# Altium project Martin_Smith_Project.PrjPcb (part 2 of 2)

## Sheet Connector Section.SchDoc
size A4; DocumentNumber: 6; SheetNumber: 6; SheetTotal: 6
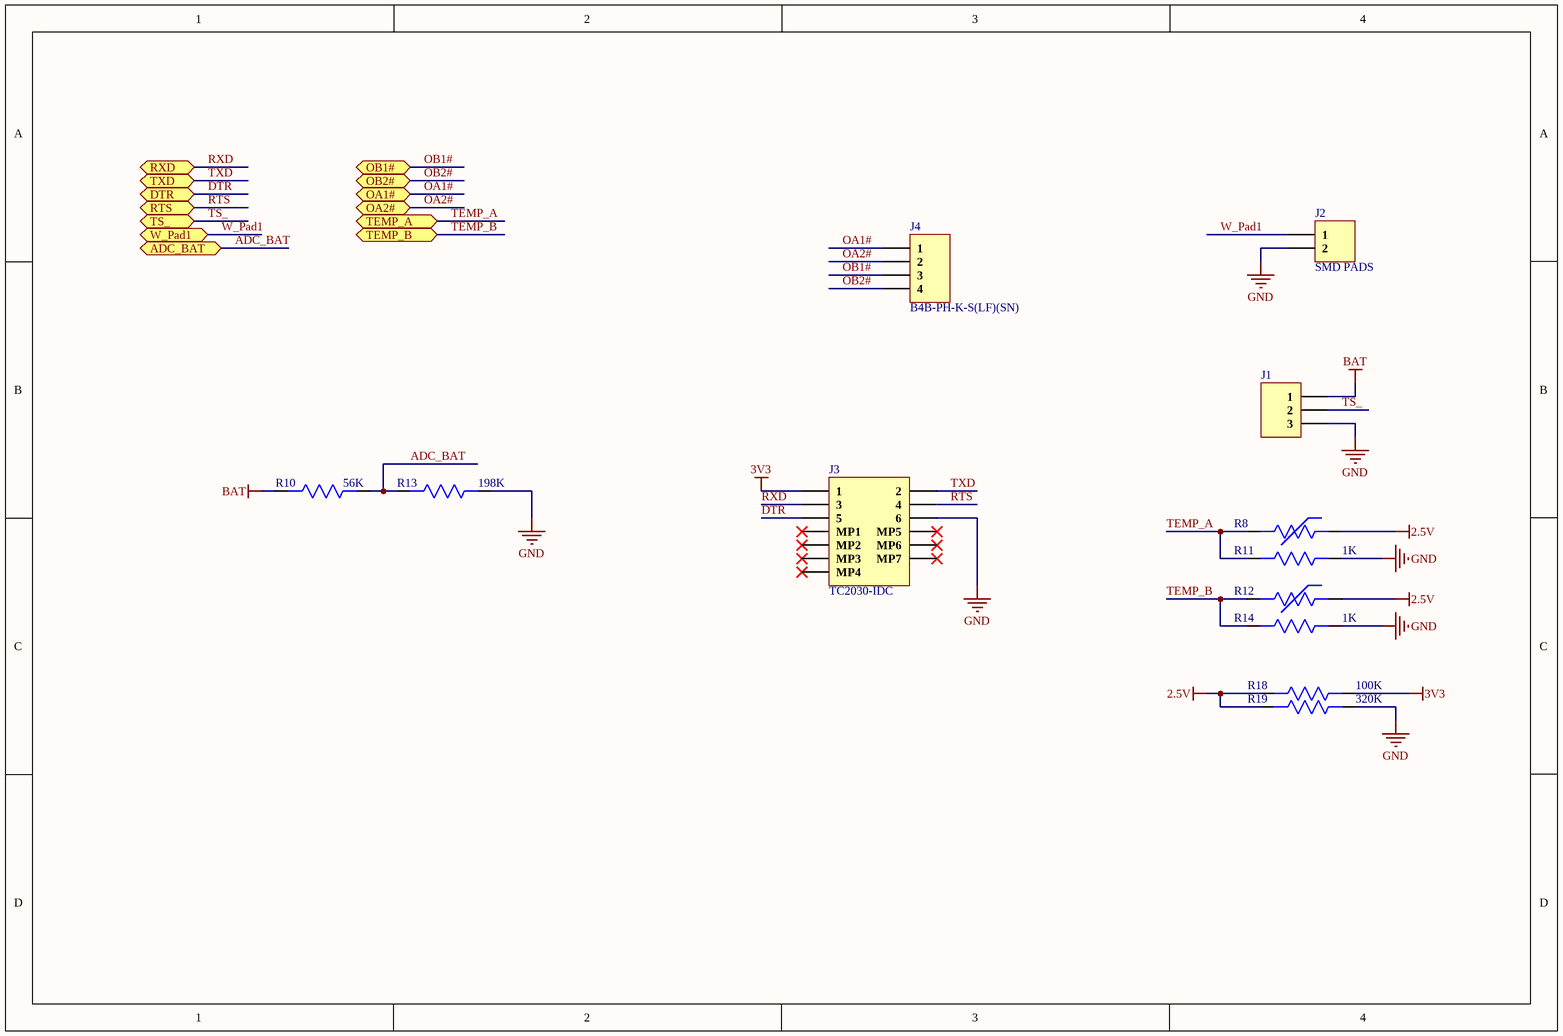
[diagram p3: Connector Section.SchDoc]

### Parts
J1  B3B-PH-K-S(LF)(SN)  [B3B-PH-K-S(LF)(SN)]  (value not drawn)
J2  SMD PADS  [SMD PAD]
J3  TC2030-IDC  [TC2030-IDC]
J4  B4B-PH-K-S(LF)(SN)  [B4B-PH-K-S(LF)(SN)]
R8  B57230V2103F260  [Res0402]  (value not drawn)
R10  56K  [Res-0201]
R11  1K  [Res-0201]
R12  B57230V2103F260  [Res0402]  (value not drawn)
R13  198K  [Res0402]
R14  1K  [Res-0201]
R18  100K  [Res-0201]
R19  320K  [Res0603]

### Ports
ADC_BAT (bidir), DTR (bidir), OA1# (bidir), OA2# (bidir), OB1# (bidir), OB2# (bidir), RTS (bidir), RXD (bidir), TEMP_A (bidir), TEMP_B (bidir), TS_ (bidir), TXD (bidir), W_Pad1 (bidir)

### Nets
2.5V: R8.1 R12.1 R18.2 R19.2
3V3: J3.1 R18.1
BAT: J1.1 R10.2
GND: J1.3 J2.2 J3.6 R11.1 R13.1 R14.1 R19.1
ADC_BAT: R10.1 R13.2 ; port ADC_BAT
DTR: J3.5 ; port DTR
OA1#: J4.1 ; port OA1#
OA2#: J4.2 ; port OA2#
OB1#: J4.3 ; port OB1#
OB2#: J4.4 ; port OB2#
RTS: J3.4 ; port RTS
RXD: J3.3 ; port RXD
TEMP_A: R8.2 R11.2 ; port TEMP_A
TEMP_B: R12.2 R14.2 ; port TEMP_B
TS_: J1.2 ; port TS_
TXD: J3.2 ; port TXD
W_Pad1: J2.1 ; port W_Pad1

Not connected (* = marked no-connect by the designer): J3 MP1* MP2* MP3* MP4* MP5* MP6* MP7*

### Library data of the parts
J1 = B3B-PH-K-S(LF)(SN): CONN HEADER VERT 3POS 2MM; Manufacturer: JST; Number of Positions: 3; Connector Type: Male Pin; Current Rating: 2A; Contact Resistance: 20mR; Voltage Rating (AC): 100V; Insulation Resistance: 1MR; Gender: Male; Supplier 1: Future Electronics; Manufacturer Part Number: B3B-PH-K-S(LF)(SN); RoHS: Yes; Category: Headers and Wire Housings; Pricing 1: 1=0.07800, 500=0.06750, 1500=0.06580, 5000=0.06400, 15000=0.06240 (USD); Mount: Through Hole; Number of Pins: 3; Contact Plating: Tin,Copper; Color: Natural; Contact Material: Brass,Tin; Housing Color: White; Housing Material: Polyamide; Min Operating Temperature: -25°C; Max Operating Temperature: 85°C; Number of Rows: 1; Packaging: Bulk; Max Current Rating: 2A; Number of Poles: 3; Voltage Rating: 100V; Termination: Solder; Fastening Type: Detent; Number of Contacts: 3; Max Voltage Rating (AC): 100V; Max Voltage Rating (DC): 100V; Working Voltage: 100V; Orientation: Straight; Length: 7.9mm; Width: 4.5mm; Height: 9.4mm; Pitch: 2mm; Lead Pitch: 2mm; Contact Mating Length: 0.13inch; Depth: 4.5mm; Lead Free: Lead Free; REACH SVHC: No SVHC; ComponentLink1URL: https://datasheet.ciiva.com/6747/80560-6747401.pdf?src-supplier=Newark; ComponentLink1Description: https://datasheet.ciiva.com/6747/80560-6747401.pdf?src-supplier=Newark; ComponentLink2URL: https://datasheet.ciiva.com/11746/0900766b80826550-11746939.pdf?src-supplier=RSComponents; ComponentLink2Description: https://datasheet.ciiva.com/11746/0900766b80826550-11746939.pdf?src-supplier=RSComponents; ComponentLink3URL: https://datasheet.ciiva.com/26894/getdatasheetpartid-448114-26894774.pdf?src-supplier=Verical; ComponentLink3Description: https://datasheet.ciiva.com/26894/getdatasheetpartid-448114-26894774.pdf?src-supplier=Verical; ComponentLink4URL: https://datasheet.ciiva.com/712/eph-712455.pdf?src-supplier=Digi-Key; ComponentLink4Description: https://datasheet.ciiva.com/712/eph-712455.pdf?src-supplier=Digi-Key; ComponentLink5URL: https://datasheet.ciiva.com/26924/getdatasheetpartid-651387-26924028.pdf?src-supplier=Verical; ComponentLink5Description: https://datasheet.ciiva.com/26924/getdatasheetpartid-651387-26924028.pdf?src-supplier=Verical; ComponentLink6URL: https://datasheet.ciiva.com/16200/eph-16200926.pdf?src-supplier=Future+Electronics; ComponentLink6Description: https://datasheet.ciiva.com/16200/eph-16200926.pdf?src-supplier=Future+Electronics; ComponentLink7URL: https://datasheet.ciiva.com/43491/741202-da-01-en-stiftleiste-gerade-3-pol-rm2-0-43491962.pdf?src-supplier=Conrad; ComponentLink7Description: https://datasheet.ciiva.com/43491/741202-da-01-en-stiftleiste-gerade-3-pol-rm2-0-43491962.pdf?src-supplier=Conrad; Supplier Part Number 1: 6478077
J2 = SMD PAD
J3 = TC2030-IDC: CABLE ADAPTER 6 POS; Manufacturer: Tag-Connect; ComponentLink1URL: http://www.tag-connect.com/Materials/TC2030-MCP%20Datasheet.pdf?src-supplier=Digi-Key; ComponentLink1Description: http://www.tag-connect.com/Materials/TC2030-MCP%20Datasheet.pdf?src-supplier=Digi-Key; Supplier 1: Digi-Key; Manufacturer Part Number: TC2030-IDC; Stock 1: 284; Pricing 1: 1=43.71 (USD); Package Quantity: 1; Supplier Part Number 1: TC2030-IDC-ND
J4 = B4B-PH-K-S(LF)(SN): CONN HEADER VERT 4POS 2MM; Manufacturer: JST; Current Rating: 2A; Voltage Rating: 100V; Contact Resistance: 20mR; Number of Poles: 4; Insulation Resistance: 1MR; Gender: Male; Connector Type: Male Pin; Supplier 1: Newark; Manufacturer Part Number: B4B-PH-K-S(LF)(SN); RoHS: Yes; Category: Connectors; Mount: Through Hole; Number of Pins: 4; Contact Material: Brass,Tin; Contact Plating: Tin,Copper; Color: Natural; Housing Color: White; Housing Material: Polyamide; Material: Polyamide; Min Operating Temperature: -25°C; Max Operating Temperature: 85°C; Number of Rows: 1; Max Current Rating: 2A; Voltage Rating (AC): 100V; Packaging: Bulk; Number of Positions: 4; Termination: Solder; Fastening Type: Detent; Number of Contacts: 4; Max Voltage Rating (AC): 100V; Max Voltage Rating (DC): 100V; Working Voltage: 100V; Orientation: Straight; Length: 9.9mm; Width: 4.5mm; Height: 9.4mm; Pitch: 2mm; Lead Pitch: 2mm; Contact Mating Length: 0.13inch; Depth: 4.5mm; REACH SVHC: No SVHC; Lead Free: Lead Free; ComponentLink1URL: https://datasheet.ciiva.com/11747/0900766b8082f552-11747200.pdf?src-supplier=RSComponents; ComponentLink1Description: https://datasheet.ciiva.com/11747/0900766b8082f552-11747200.pdf?src-supplier=RSComponents; ComponentLink2URL: https://datasheet.ciiva.com/712/eph-712488.pdf?src-supplier=Digi-Key; ComponentLink2Description: https://datasheet.ciiva.com/712/eph-712488.pdf?src-supplier=Digi-Key; ComponentLink3URL: https://datasheet.ciiva.com/16209/eph-16209245.pdf?src-supplier=Future+Electronics; ComponentLink3Description: https://datasheet.ciiva.com/16209/eph-16209245.pdf?src-supplier=Future+Electronics; ComponentLink4URL: https://datasheet.ciiva.com/43491/741223-da-01-en-stiftleiste-gerade-4-pol-rm2-0-43491964.pdf?src-supplier=Conrad; ComponentLink4Description: https://datasheet.ciiva.com/43491/741223-da-01-en-stiftleiste-gerade-4-pol-rm2-0-43491964.pdf?src-supplier=Conrad; Supplier Part Number 1: 37K9958
R8 R12 = B57230V2103F260: THERMISTOR NTC 10KOHM 3380K 0402; Manufacturer: TDK EPCOS; Tolerance: 1%; Resistance: 10kR; Power Rating: 150mW; Supplier 1: Digi-Key; Manufacturer Part Number: B57230V2103F260; RoHS: Yes; Category: Thermistors; Stock 1: 17040; Pricing 1: 1=0.12000, 5=0.11400, 10=0.10200, 25=0.09360, 50=0.07500, 100=0.06430, 500=0.05628, 1000=0.04824, 5000=0.04288 (USD); Mount: Surface Mount; Case/Package: 0402; Number of Pins: 2; Case Code (Metric): 1005; Case Code (Imperial): 0402; Contact Plating: Tin; Min Operating Temperature: -55°C; Max Operating Temperature: 125°C; Package Quantity: 10000; Packaging: Tape and Reel; Max Power Dissipation: 150mW; Termination: SMD/SMT; Series: -; Resistance Tolerance: 1%; Length: 1mm; Width: 0.8mm; Height: 0.9mm; Depth: 0.5mm; REACH SVHC: No SVHC; RoHS Compliant: Yes; ComponentLink1URL: https://datasheet.ciiva.com/29706/ntc-smd-standard-series-0402-29706167.pdf?src-supplier=Digi-Key; ComponentLink1Description: https://datasheet.ciiva.com/29706/ntc-smd-standard-series-0402-29706167.pdf?src-supplier=Digi-Key; ComponentLink2URL: https://datasheet.ciiva.com/29706/ntc-smd-standard-series-0402-29706168.pdf?src-supplier=Digi-Key; ComponentLink2Description: https://datasheet.ciiva.com/29706/ntc-smd-standard-series-0402-29706168.pdf?src-supplier=Digi-Key; ComponentLink3URL: https://datasheet.ciiva.com/46409/1835848-46409416.pdf?src-supplier=Element14; ComponentLink3Description: https://datasheet.ciiva.com/46409/1835848-46409416.pdf?src-supplier=Element14; ComponentLink4URL: https://datasheet.ciiva.com/29706/ntc-smd-standard-series-0402-29706169.pdf?src-supplier=Digi-Key; ComponentLink4Description: https://datasheet.ciiva.com/29706/ntc-smd-standard-series-0402-29706169.pdf?src-supplier=Digi-Key; ComponentLink5URL: https://datasheet.ciiva.com/46409/1835848-46409417.pdf?src-supplier=Element14; ComponentLink5Description: https://datasheet.ciiva.com/46409/1835848-46409417.pdf?src-supplier=Element14; Supplier Part Number 1: 495-5814-1-ND
R10 = AC0201FR-0756KL: RES SMD 56K OHM 1% 1/20W 0201; Manufacturer: Yageo; Resistance: 56kR; Temperature Coefficient: 200ppm/°C; Max Power Dissipation: 50mW; ComponentLink1URL: http://www.yageo.com/NewPortal/yageodocoutput?fileName=/pdf/R-Chip/PYu-AC_51_RoHS_L_5.pdf&src-supplier=Digi-Key; ComponentLink1Description: http://www.yageo.com/NewPortal/yageodocoutput?fileName=/pdf/R-Chip/PYu-AC_51_RoHS_L_5.pdf&src-supplier=Digi-Key; ComponentLink2URL: http://www.yageo.com/NewPortal/yageodocoutput?fileName=/pdf/R-Chip/PYu-AC_51_RoHS_L_6.pdf&src-supplier=Digi-Key; ComponentLink2Description: http://www.yageo.com/NewPortal/yageodocoutput?fileName=/pdf/R-Chip/PYu-AC_51_RoHS_L_6.pdf&src-supplier=Digi-Key; Supplier 1: Digi-Key; Manufacturer Part Number: AC0201FR-0756KL; Stock 1: 23567; Pricing 1: 1=0.10000, 10=0.05700, 100=0.02320, 1000=0.01044, 2500=0.00906, 5000=0.00749 (USD); Case/Package: 0201; Min Operating Temperature: -55°C; Max Operating Temperature: 155°C; Tolerance: 1%; Packaging: Tape and Reel; Features: Moisture Resistant,Automotive AEC-Q200; Resistor Type: Thick Film; Number of Terminations: 2; Length: 0.024inch; Width: 0.012inch; Height: 0.01inch; RoHS Compliant: Yes; Supplier Part Number 1: YAG5226CT-ND; RoHS: Yes; Category: Chip SMD Resistors
R11 R14 = RC0201FR-071KP: RES 1K OHM 1% 1/20W 0201; Manufacturer: Yageo; Supplier 1: Digi-Key; Manufacturer Part Number: RC0201FR-071KP; RoHS: Yes; Stock 1: 4800; Pricing 1: 1=0.11000, 10=0.10200, 100=0.03940, 1000=0.01734, 2500=0.01497, 5000=0.01340 (USD); RoHS Compliant: Yes; Supplier Part Number 1: 13-RC0201FR-071KPCT-ND
R13 = RN73H1ETTP1983D25: RES 198K OHM 0.5% 1/16W 0402; Manufacturer: KOA Speer; Resistance: 198kR; Power Rating: 63mW; Voltage Rating: 50V; Temperature Coefficient: 25ppm/°C; ComponentLink1URL: http://www.yageo.com/documents/recent/PYu-RC_Group_51_RoHS_L_9.pdf?src-supplier=Digi-Key; ComponentLink1Description: http://www.yageo.com/documents/recent/PYu-RC_Group_51_RoHS_L_9.pdf?src-supplier=Digi-Key; ComponentLink2URL: http://www.yageo.com.tw/exep/pages/download/literatures/PYu-R_INT-thick_7.pdf?src-supplier=Digi-Key; ComponentLink2Description: http://www.yageo.com.tw/exep/pages/download/literatures/PYu-R_INT-thick_7.pdf?src-supplier=Digi-Key; Supplier 1: Digi-Key; Manufacturer Part Number: RN73H1ETTP1983D25; Stock 1: 0; Pricing 1: 1000=0.0784 (USD); Case/Package: 0402; Case Code (Imperial): 0402; Case Code (Metric): 1005; Min Operating Temperature: -55°C; Max Operating Temperature: 155°C; Tolerance: 0.5%; Packaging: Tape and Reel; Package Quantity: 10000; RoHS Compliant: Yes; ComponentLink3URL: http://www.koaspeer.com/products/resistors/surface-mount-resistors/rn73h/?src-supplier=Mouser; ComponentLink3Description: http://www.koaspeer.com/products/resistors/surface-mount-resistors/rn73h/?src-supplier=Mouser; Supplier Part Number 1: 2019-RN73H1ETTP1983D25CT-ND
R18 = RC0201FR-07100KL: RES SMD 100K OHM 1% 1/20W 0201; Manufacturer: Yageo; Resistance: 100kR; Power Rating: 50mW; Voltage Rating: 25V; Temperature Coefficient: 200ppm/°C; ComponentLink1URL: http://www.yageo.com/documents/recent/PYu-RC_Group_51_RoHS_L_9.pdf?src-supplier=Digi-Key; ComponentLink1Description: http://www.yageo.com/documents/recent/PYu-RC_Group_51_RoHS_L_9.pdf?src-supplier=Digi-Key; ComponentLink2URL: http://www.yageo.com.tw/exep/pages/download/literatures/PYu-R_INT-thick_7.pdf?src-supplier=Digi-Key; ComponentLink2Description: http://www.yageo.com.tw/exep/pages/download/literatures/PYu-R_INT-thick_7.pdf?src-supplier=Digi-Key; Supplier 1: Digi-Key; Manufacturer Part Number: RC0201FR-07100KL; Stock 1: 2817321; Pricing 1: 1=0.1, 10=0.036, 100=0.0148, 1000=0.0067, 2500=0.0058, 5000=0.0048 (USD); Case/Package: 0201; Number of Pins: 2; Case Code (Imperial): 0201; Case Code (Metric): 0603; Contact Plating: Tin,Matte; Size Code: 0201; Min Operating Temperature: -55°C; Max Operating Temperature: 125°C; Tolerance: 1%; Packaging: Tape and Reel; Package Quantity: 10000; Termination: SMD/SMT; Resistor Type: Thick Film; Number of Terminations: 2; Max Power Dissipation: 50mW; Voltage Rating (DC): 25V; Features: Moisture Resistant; Series: RC; Resistance Tolerance: 1%; Construction: Rectangular; Length: 0.024inch; Width: 0.012inch; Height: 0.01inch; Depth: 0.3mm; REACH SVHC: No SVHC; Military Standard: Not; Lead Free: Lead Free; RoHS Compliant: Yes; ComponentLink3URL: http://www.farnell.com/datasheets/2167052.pdf?src-supplier=Element14; ComponentLink3Description: http://www.farnell.com/datasheets/2167052.pdf?src-supplier=Element14; ComponentLink4URL: http://www.yageo.com/documents/recent/PYu-RC_Group_51_RoHS_L_10.pdf?src-supplier=Digi-Key; ComponentLink4Description: http://www.yageo.com/documents/recent/PYu-RC_Group_51_RoHS_L_10.pdf?src-supplier=Digi-Key; ComponentLink5URL: https://www.verical.com/server-webapp/html/getDatasheet?partID=420441&src-supplier=Verical; ComponentLink5Description: https://www.verical.com/server-webapp/html/getDatasheet?partID=420441&src-supplier=Verical; ComponentLink6URL: http://www.farnell.com/datasheets/1421516.pdf?src-supplier=Element14; ComponentLink6Description: http://www.farnell.com/datasheets/1421516.pdf?src-supplier=Element14; ComponentLink7URL: http://www.yageo.com/documents/recent/PYu-RC0201_51_RoHS_L_8.pdf?src-supplier=Avnet+Europe; ComponentLink7Description: http://www.yageo.com/documents/recent/PYu-RC0201_51_RoHS_L_8.pdf?src-supplier=Avnet+Europe; Supplier Part Number 1: 311-100KMCT-ND
R19 = RN73H1JTTD3203C25: RES 320K OHM 0.25% 1/10W 0603

## Sheet Driver Section.SchDoc
size A4; DocumentNumber: 5; SheetNumber: 5; SheetTotal: 6
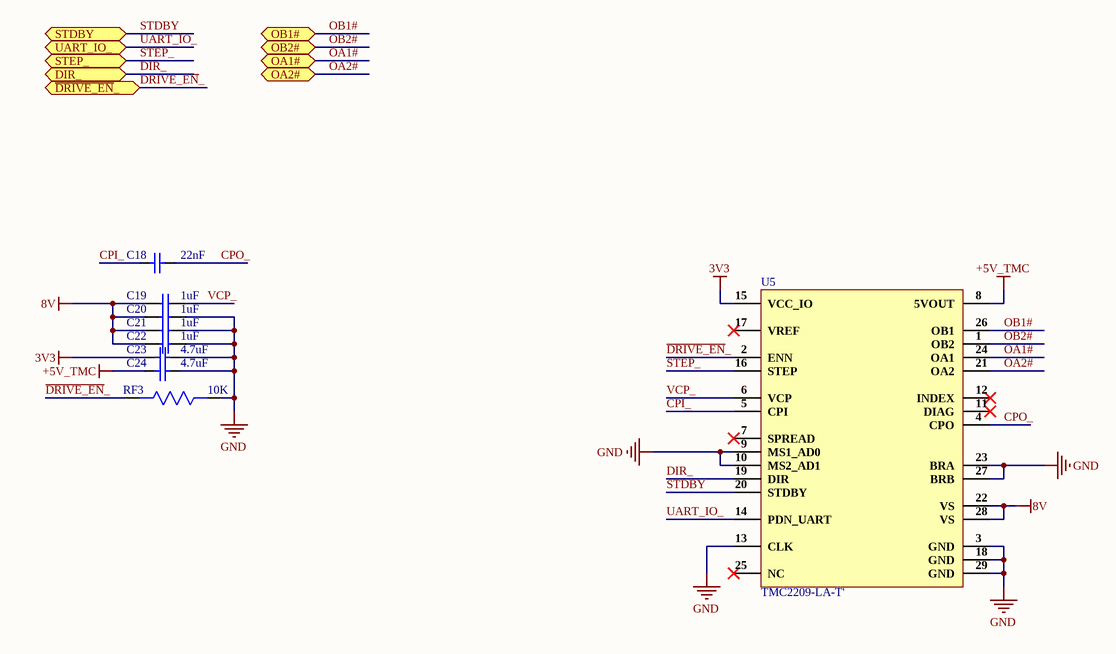
[diagram p4: Driver Section.SchDoc]

### Parts
C18  22nF  [CAP 0201]
C19  1uF  [CAP 0201]
C20  1uF  [CAP 0201]
C21  1uF  [CAP 0201]
C22  1uF  [CAP 0201]
C23  4.7uF  [Cap0402]
C24  4.7uF  [Cap0402]
RF3  10K  [Res-0201]
U5  TMC2209-LA-T'  [QFN-28]

### Ports
DIR_ (bidir), OA1# (bidir), OA2# (bidir), OB1# (bidir), OB2# (bidir), STDBY (bidir), STEP_ (bidir), UART_IO_ (bidir), ~{DRI}~{VE_EN}_ (bidir)

### Nets
3V3: C23.2 U5.15(VCC_IO)
8V: C19.1 C20.1 C21.1 C22.1 U5.22(VS) U5.28(VS)
+5V_TMC: C24.2 U5.8(5VOUT)
GND: C20.2 C21.2 C22.2 C23.1 C24.1 RF3.1 U5.3(GND) U5.9(MS1_AD0) U5.10(MS2_AD1) U5.13(CLK) U5.18(GND) U5.23(BRA) U5.27(BRB) U5.29(GND)
~{DRI}~{VE_EN}_: RF3.2 U5.2(ENN) ; port ~{DRI}~{VE_EN}_
CPI_: C18.2 U5.5(CPI)
CPO_: C18.1 U5.4(CPO)
DIR_: U5.19(DIR) ; port DIR_
OA1#: U5.24(OA1) ; port OA1#
OA2#: U5.21(OA2) ; port OA2#
OB1#: U5.26(OB1) ; port OB1#
OB2#: U5.1(OB2) ; port OB2#
STDBY: U5.20(STDBY) ; port STDBY
STEP_: U5.16(STEP) ; port STEP_
UART_IO_: U5.14(PDN_UART) ; port UART_IO_
VCP_: C19.2 U5.6(VCP)

Not connected (* = marked no-connect by the designer): U5 7(SPREAD)* 11(DIAG)* 12(INDEX)* 17(VREF)* 25(NC)*

### Library data of the parts
C18 = TMK063BJ223KP-F: CAP CER 0.022UF 25V X5R 0201; Manufacturer: Taiyo Yuden; Tolerance: 10%; Supplier 1: Digi-Key; Manufacturer Part Number: TMK063BJ223KP-F; RoHS: No; Category: Ceramic Capacitors; Stock 1: 108943; Pricing 1: 1=0.10000, 10=0.02100, 50=0.01120, 100=0.00920, 500=0.00654, 1000=0.00514, 2500=0.00468, 5000=0.00430 (USD); Mount: Surface Mount; Case/Package: 0201; Case Code (Imperial): 0201; Case Code (Metric): 0603; Min Operating Temperature: -55°C; Max Operating Temperature: 85°C; Packaging: Tape and Reel; Capacitance: 22nF; Voltage Rating: 25V; ComponentLink1URL: https://ds.yuden.co.jp/TYCOMPAS/ut/detail?pn=TMK063BJ223KP-F &amp;u=M&src-supplier=Digi-Key; ComponentLink1Description: https://ds.yuden.co.jp/TYCOMPAS/ut/detail?pn=TMK063BJ223KP-F &amp;u=M&src-supplier=Digi-Key; ComponentLink2URL: http://ds.yuden.co.jp/TYCOMPAS/ut/detail.do?productNo=TMK063BJ223KP-F&amp;fileName=TMK063BJ223KP-F_SS&amp;mode=specSheetDownload&src-supplier=Digi-Key; ComponentLink2Description: http://ds.yuden.co.jp/TYCOMPAS/ut/detail.do?productNo=TMK063BJ223KP-F&amp;fileName=TMK063BJ223KP-F_SS&amp;mode=specSheetDownload&src-supplier=Digi-Key; Supplier Part Number 1: 587-6154-1-ND
C19-C22 = CL03A105MO3NRNH: CAP CER 1UF 16V X5R 0201; Manufacturer: Samsung; Tolerance: 20%; Supplier 1: Digi-Key; Manufacturer Part Number: CL03A105MO3NRNH; RoHS: Yes; Category: Ceramic Capacitors; Stock 1: 66067; Pricing 1: 1=0.27000, 10=0.18500, 50=0.11080, 100=0.09360, 500=0.06406, 1000=0.05667, 2500=0.05421, 5000=0.04928 (USD); Mount: Surface Mount; Case/Package: 0201; Case Code (Metric): 0603; Case Code (Imperial): 0201; Min Operating Temperature: -55°C; Max Operating Temperature: 85°C; Packaging: Tape and Reel; Capacitance: 1uF; Voltage Rating: 16V; Length: 0.024inch; Width: 0.012inch; Thickness: 0.013inch; RoHS Compliant: Yes; ComponentLink1URL: http://www.samsungsem.com/kr/support/product-search/mlcc/CL03A105MO3NRNH.jsp?src-supplier=Digi-Key; ComponentLink1Description: http://www.samsungsem.com/kr/support/product-search/mlcc/CL03A105MO3NRNH.jsp?src-supplier=Digi-Key; Supplier Part Number 1: 1276-6798-1-ND
C23 C24 = GRM155R61A475MEAAD: CAP CER 4.7UF 10V X5R 0402; Manufacturer: Murata; Tolerance: 20%; Supplier 1: Arrow Electronics; Manufacturer Part Number: GRM155R61A475MEAAD; Category: Ceramic Capacitors; Stock 1: 5; Pricing 1: 1=0.15280, 100000=0.02590, 1000000=0.02570, 10000000=0.02490 (USD); Mount: Surface Mount; Case/Package: 0402; Case Code (Imperial): 0402; Case Code (Metric): 1005; Min Operating Temperature: -55°C; Max Operating Temperature: 85°C; Packaging: Tape and Reel; Capacitance: 4.7uF; Voltage Rating: 10V; ComponentLink1URL: http://www.farnell.com/datasheets/2189109.pdf?src-supplier=Farnell; ComponentLink1Description: http://www.farnell.com/datasheets/2189109.pdf?src-supplier=Farnell; ComponentLink2URL: https://search.murata.co.jp/Ceramy/image/img/A01X/G101/ENG/GRM155R61A475MEAA-01.pdf?src-supplier=Digi-Key; ComponentLink2Description: https://search.murata.co.jp/Ceramy/image/img/A01X/G101/ENG/GRM155R61A475MEAA-01.pdf?src-supplier=Digi-Key; ComponentLink3URL: http://www.farnell.com/datasheets/2189109.pdf?src-supplier=Newark; ComponentLink3Description: http://www.farnell.com/datasheets/2189109.pdf?src-supplier=Newark; ComponentLink4URL: http://www.farnell.com/datasheets/2189109.pdf?src-supplier=Element14; ComponentLink4Description: http://www.farnell.com/datasheets/2189109.pdf?src-supplier=Element14; ComponentLink5URL: http://datasheet.octopart.com/GRM155R61A475MEAAD-Murata-datasheet-138740730.pdf?src-supplier=Ciiva+Crawler; ComponentLink5Description: http://datasheet.octopart.com/GRM155R61A475MEAAD-Murata-datasheet-138740730.pdf?src-supplier=Ciiva+Crawler; ComponentLink6URL: http://datasheet.octopart.com/GRM155R61A475MEAAD-Murata-datasheet-140690084.pdf?src-supplier=Ciiva+Crawler; ComponentLink6Description: http://datasheet.octopart.com/GRM155R61A475MEAAD-Murata-datasheet-140690084.pdf?src-supplier=Ciiva+Crawler; ComponentLink7URL: http://datasheet.octopart.com/GRM155R61A475MEAAD-Murata-datasheet-141266224.pdf?src-supplier=Ciiva+Crawler; ComponentLink7Description: http://datasheet.octopart.com/GRM155R61A475MEAAD-Murata-datasheet-141266224.pdf?src-supplier=Ciiva+Crawler; ComponentLink8URL: http://datasheet.octopart.com/GRM155R61A475MEAAD-Murata-datasheet-68589269.pdf?src-supplier=Newark; ComponentLink8Description: http://datasheet.octopart.com/GRM155R61A475MEAAD-Murata-datasheet-68589269.pdf?src-supplier=Newark; ComponentLink9URL: http://datasheet.octopart.com/GRM155R61A475MEAAD-Murata-datasheet-8819587.pdf; ComponentLink9Description: http://datasheet.octopart.com/GRM155R61A475MEAAD-Murata-datasheet-8819587.pdf; ComponentLink10URL: http://datasheet.octopart.com/GRM155R61A475MEAAD-Murata-datasheet-10025737.pdf; ComponentLink10Description: http://datasheet.octopart.com/GRM155R61A475MEAAD-Murata-datasheet-10025737.pdf; ComponentLink11URL: http://datasheet.octopart.com/GRM155R61A475MEAAD-Murata-datasheet-11978611.pdf; ComponentLink11Description: http://datasheet.octopart.com/GRM155R61A475MEAAD-Murata-datasheet-11978611.pdf; ComponentLink12URL: http://datasheet.octopart.com/GRM155R61A475MEAAD-Murata-datasheet-12510076.pdf; ComponentLink12Description: http://datasheet.octopart.com/GRM155R61A475MEAAD-Murata-datasheet-12510076.pdf; ComponentLink13URL: http://datasheet.octopart.com/GRM155R61A475MEAAD-Murata-datasheet-12515295.pdf; ComponentLink13Description: http://datasheet.octopart.com/GRM155R61A475MEAAD-Murata-datasheet-12515295.pdf; Supplier Part Number 1: GRM155R61A475MEAAD
RF3 = RC0201JR-0710KL: RES SMD 10K OHM 5% 1/20W 0201; Manufacturer: Yageo; Voltage Rating (DC): 25V; Power Rating: 50mW; Resistance: 10kR; Temperature Coefficient: 200ppm/°C; Case Code (Imperial): 0201; Case Code (Metric): 0603; Case/Package: 0201; Category: Chip SMD Resistors; Contact Plating: Tin,Matte; Depth: 0.3mm; Lead Free: Lead Free; Length: 0.6mm; Manufacturer Part Number: RC0201JR-0710KL; Max Operating Temperature: 125°C; Military Standard: Not; Min Operating Temperature: -55°C; Packaging: Tape and Reel; Radiation Hardening: No; REACH SVHC: Unknown; Resistor Type: Thick Film; Termination: SMD/SMT; Tolerance: 5%; Voltage Rating: 25V; ComponentLink1Description: New link; ComponentLink1URL: *; Supplier 1: Digi-Key; RoHS: Yes; Stock 1: 1488597; Pricing 1: 1=0.10000, 10=0.02600, 100=0.01050, 1000=0.00472, 2500=0.00410, 5000=0.00338 (USD); ComponentLink2URL: https://datasheet.ciiva.com/8891/pyu-rc0201-51-rohs-l-8-8891388.pdf?src-supplier=Avnet; ComponentLink2Description: https://datasheet.ciiva.com/8891/pyu-rc0201-51-rohs-l-8-8891388.pdf?src-supplier=Avnet; ComponentLink3URL: https://datasheet.ciiva.com/7672/1563626-7672253.pdf?src-supplier=Element14; ComponentLink3Description: https://datasheet.ciiva.com/7672/1563626-7672253.pdf?src-supplier=Element14; ComponentLink4URL: https://datasheet.ciiva.com/28405/pyu-rc0201-51-rohs-l-8-28405613.pdf?src-supplier=Avnet+Europe; ComponentLink4Description: https://datasheet.ciiva.com/28405/pyu-rc0201-51-rohs-l-8-28405613.pdf?src-supplier=Avnet+Europe; ComponentLink5URL: https://datasheet.ciiva.com/7672/1563626-7672254.pdf?src-supplier=Element14; ComponentLink5Description: https://datasheet.ciiva.com/7672/1563626-7672254.pdf?src-supplier=Element14; ComponentLink6URL: https://datasheet.ciiva.com/7660/1421516-7660810.pdf?src-supplier=Element14; ComponentLink6Description: https://datasheet.ciiva.com/7660/1421516-7660810.pdf?src-supplier=Element14; ComponentLink7URL: https://datasheet.ciiva.com/16856/pyu-rc0201-51-rohs-l-8-16856011.pdf?src-supplier=Avnet+Europe; ComponentLink7Description: https://datasheet.ciiva.com/16856/pyu-rc0201-51-rohs-l-8-16856011.pdf?src-supplier=Avnet+Europe; ComponentLink8URL: https://datasheet.ciiva.com/46391/1421516-46391291.pdf?src-supplier=Element14; ComponentLink8Description: https://datasheet.ciiva.com/46391/1421516-46391291.pdf?src-supplier=Element14; Supplier Part Number 1: 311-10KNCT-ND
U5 = TMC2209-LA-T: Motor Driver, Stepper, QFN-28; Manufacturer: Trinamic; Supplier 1: Digi-Key; Manufacturer Part Number: TMC2209-LA-T; RoHS: No; Stock 1: 1949; Pricing 1: 1=2.74000, 50=2.46000, 100=2.17000, 500=1.88000, 1000=1.59001 (USD); Supplier Part Number 1: 1460-1398-1-ND

## Sheet Control_Sheet.SchDoc
size A
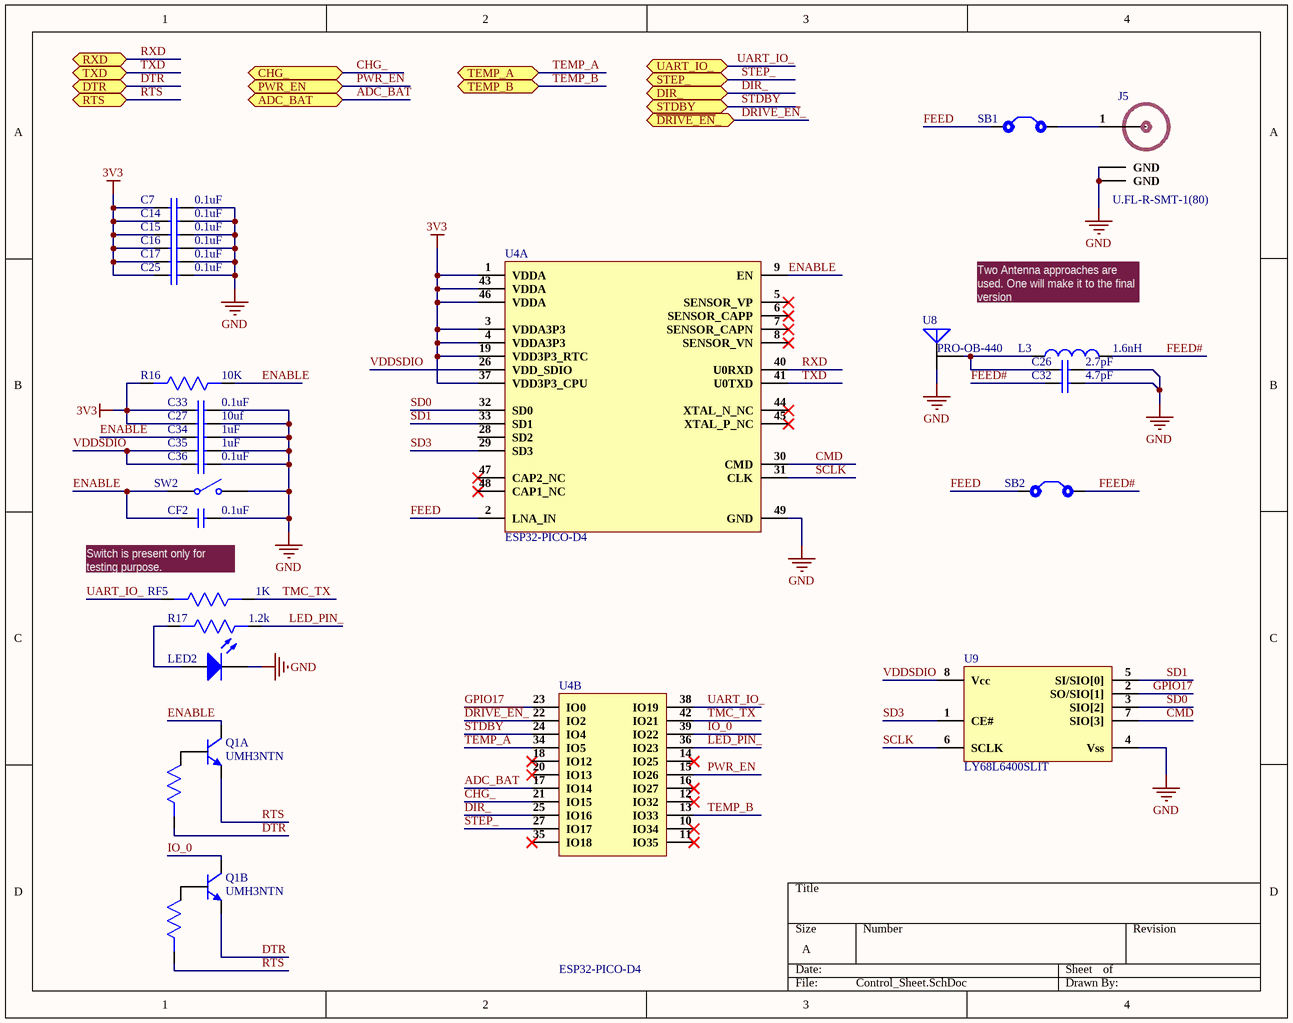
[diagram p5: Control_Sheet.SchDoc]

### Parts
C7  0.1uF  [CAP 0201]
C14  0.1uF  [CAP 0201]
C15  0.1uF  [CAP 0201]
C16  0.1uF  [CAP 0201]
C17  0.1uF  [CAP 0201]
C25  0.1uF  [CAP 0201]
C26  2.7pF  [Cap0402]
C27  10uf  [Cap0603]
C32  4.7pF  [Cap0402]
C33  0.1uF  [CAP 0201]
C34  1uF  [CAP 0201]
C35  1uF  [CAP 0201]
C36  0.1uF  [CAP 0201]
CF2  0.1uF  [CAP 0201]
J5  U.FL-R-SMT-1(80)  [U.FL-R-SMT-1(80)]
L3  1.6nH  [Ind 0402]
LED2  IN-S63AT5UW  [LED 0603]  (value not drawn)
Q1  UMH3NTN  [SOT-363]  (parts A,B of 2)
R16  10K  [Res-0201]
R17  1.2k  [Res-0201]
RF5  1K  [Res-0201]
SB1  Solder Bridge  [Solder Bridge]  (value not drawn)
SB2  Solder Bridge  [Solder Bridge]  (value not drawn)
SW2  434121025816  [434121025816]  (value not drawn)
U4  ESP32-PICO-D4  [48-SMD Module]  (parts A,B of 2)
U8  PRO-OB-440  [PRO-OB-440]
U9  LY68L6400SLIT  [SOP-8]

### Ports
ADC_BAT (bidir), CHG_ (bidir), DIR_ (bidir), DTR (bidir), PWR_EN (bidir), RTS (bidir), RXD (bidir), STDBY (bidir), STEP_ (bidir), TEMP_A (bidir), TEMP_B (bidir), TXD (bidir), UART_IO_ (bidir), ~{DRI}~{VE_EN}_ (bidir)

### Nets
3V3: C7.1 C14.1 C15.1 C16.1 C17.1 C25.1 C27.1 C33.1 R16.2 U4.1(VDDA) U4.3(VDDA3P3) U4.4(VDDA3P3) U4.19(VDD3P3_RTC) U4.37(VDD3P3_CPU) U4.43(VDDA) U4.46(VDDA)
GND: C7.2 C14.2 C15.2 C16.2 C17.2 C25.2 C26.2 C27.2 C32.2 C33.2 C34.2 C35.2 C36.2 CF2.2 J5.2(GND) J5.3(GND) LED2.1(K) SW2.2 U4.49(GND) U8.1(A) U9.4(Vss)
~{DRI}~{VE_EN}_: U4.22(IO2) ; port ~{DRI}~{VE_EN}_
ADC_BAT: U4.17(IO14) ; port ADC_BAT
CHG_: U4.21(IO15) ; port CHG_
CMD: U4.30(CMD) U9.7(SIO[3])
DIR_: U4.25(IO16) ; port DIR_
DTR: Q1.2 Q1.4(E) ; port DTR
ENABLE: C34.1 CF2.1 Q1.6(C) R16.1 SW2.1 U4.9(EN)
FEED: SB1.1 SB2.1 U4.2(LNA_IN)
FEED#: C32.1 L3.2 SB2.2
GPIO17: U4.23(IO0) U9.2(SO/SIO[1])
IO_0: Q1.3(C) U4.39(IO22)
LED_PIN_: R17.1 U4.36(IO23)
PWR_EN: U4.15(IO26) ; port PWR_EN
RTS: Q1.1(E) Q1.5 ; port RTS
RXD: U4.40(U0RXD) ; port RXD
SCLK: U4.31(CLK) U9.6(SCLK)
SD0: U4.32(SD0) U9.3(SIO[2])
SD1: U4.33(SD1) U9.5(SI/SIO[0])
SD3: U4.29(SD3) U9.1(CE#)
STDBY: U4.24(IO4) ; port STDBY
STEP_: U4.27(IO17) ; port STEP_
TEMP_A: U4.34(IO5) ; port TEMP_A
TEMP_B: U4.13(IO33) ; port TEMP_B
TMC_TX: RF5.1 U4.42(IO21)
TXD: U4.41(U0TXD) ; port TXD
UART_IO_: RF5.2 U4.38(IO19) ; port UART_IO_
VDDSDIO: C35.1 C36.1 U4.26(VDD_SDIO) U9.8(Vcc)
NetC26_1: C26.1 L3.1 U8.2(A)
NetJ5_1: J5.1(RF_IN) SB1.2
NetLED2_2: LED2.2(A) R17.2

Not connected (* = marked no-connect by the designer): U4 5(SENSOR_VP)* 6(SENSOR_CAPP)* 7(SENSOR_CAPN)* 8(SENSOR_VN)* 10(IO34)* 11(IO35)* 12(IO32)* 14(IO25)* 16(IO27)* 18(IO12)* 20(IO13)* 28(SD2) 35(IO18)* 44(XTAL_N_NC)* 45(XTAL_P_NC)* 47(CAP2_NC)* 48(CAP1_NC)*; U8 3(A) 4(A)

### Notes on the sheet
- Two Antenna approaches are used. One will make it to the final version
- Switch is present only for testing purpose.

### Library data of the parts
C7 C14-C17 C25 C33 C36 CF2 = GRM033R6YA104ME14D: CAP CER 0.1UF 35V X5R 0201; Manufacturer: Murata; Tolerance: 20%; Capacitance: 100nF; Supplier 1: Digi-Key; Manufacturer Part Number: GRM033R6YA104ME14D; RoHS: Yes; Category: Ceramic Capacitors; Stock 1: 49800; Pricing 1: 1=0.10000, 10=0.05600, 50=0.03040, 100=0.02490, 500=0.01778, 1000=0.01398, 2500=0.01270, 5000=0.01169 (USD); Mount: Surface Mount; Case/Package: 0201; Weight: 1.2E-05oz; Case Code (Metric): 0603; Case Code (Imperial): 0201; Min Operating Temperature: -55°C; Max Operating Temperature: 85°C; Dielectric: X5R; Termination: SMD/SMT; Voltage Rating (DC): 35V; Package Quantity: 15000; Packaging: Tape and Reel; Voltage Rating: 35V; Length: 0.024inch; Height: 0.3mm; Width: 0.012inch; Thickness: 0.013inch; ComponentLink1URL: http://www.mouser.com/ds/2/281/c02e-2905.pdf?src-supplier=Mouser; ComponentLink1Description: http://www.mouser.com/ds/2/281/c02e-2905.pdf?src-supplier=Mouser; ComponentLink2URL: http://search.murata.co.jp/Ceramy/image/img/A01X/G101/ENG/GRM033R6YA104ME14-01.pdf?src-supplier=Digi-Key; ComponentLink2Description: http://search.murata.co.jp/Ceramy/image/img/A01X/G101/ENG/GRM033R6YA104ME14-01.pdf?src-supplier=Digi-Key; Supplier Part Number 1: 490-10431-1-ND
C26 = 04023A2R7BAT2A: CAP CER 2.7PF 25V NP0 0402; Manufacturer: Kyocera AVX; Dielectric: C0G; Temperature Coefficient: 0ppm/°C; Supplier 1: Digi-Key; Manufacturer Part Number: 04023A2R7BAT2A; Stock 1: 28479; Pricing 1: 1=0.32, 10=0.218, 50=0.1452, 100=0.1234, 500=0.08712, 1000=0.07623, 2500=0.0726, 5000=0.06716 (USD); Mount: Surface Mount; Case/Package: 0402; Case Code (Metric): 1005; Case Code (Imperial): 0402; Min Operating Temperature: -55°C; Max Operating Temperature: 125°C; Package Quantity: 10000; Capacitance: 2.7pF; Voltage Rating: 25V; Packaging: Tape and Reel; Voltage Rating (DC): 25V; Termination: SMD/SMT; Length: 1mm; Width: 0.02inch; Thickness: 0.022inch; Depth: 0.5mm; Radiation Hardening: No; Lead Free: Lead Free; ComponentLink1URL: http://datasheets.avx.com/C0GNP0-Dielectric.pdf?src-supplier=Digi-Key; ComponentLink1Description: http://datasheets.avx.com/C0GNP0-Dielectric.pdf?src-supplier=Digi-Key; ComponentLink2URL: http://www.avx.com/docs/Catalogs/ccog.pdf?src-supplier=Future+Electronics; ComponentLink2Description: http://www.avx.com/docs/Catalogs/ccog.pdf?src-supplier=Future+Electronics; ComponentLink3URL: http://www.avxcorp.com/docs/Catalogs/ccog.pdf?src-supplier=Avnet; ComponentLink3Description: http://www.avxcorp.com/docs/Catalogs/ccog.pdf?src-supplier=Avnet; Supplier Part Number 1: 478-12612-6-ND
C27 = GRM188R61E106KA73D: CAP CER 10UF 25V X5R 0603; Manufacturer: Murata; Supplier 1: Digi-Key; Manufacturer Part Number: GRM188R61E106KA73D; Stock 1: 20478; Pricing 1: 1=0.32, 10=0.225, 50=0.1574, 100=0.135, 500=0.10122, 1000=0.08548 (USD); Case/Package: 0603; ComponentLink1URL: https://search.murata.co.jp/Ceramy/image/img/A01X/G101/ENG/GRM188R61E106KA73-01.pdf?src-supplier=Digi-Key; ComponentLink1Description: https://search.murata.co.jp/Ceramy/image/img/A01X/G101/ENG/GRM188R61E106KA73-01.pdf?src-supplier=Digi-Key; Supplier Part Number 1: 490-18214-6-ND
C32 = 885012005023: CAP CER 4.7PF 16V C0G/NP0 0402; Manufacturer: Wurth Electronics; Supplier 1: Digi-Key; Manufacturer Part Number: 885012005023; Stock 1: 8921; Pricing 1: 1=0.1, 10=0.015, 100=0.0134, 500=0.01188 (USD); Mount: Surface Mount; Case/Package: 0402; Case Code (Metric): 1005; Case Code (Imperial): 0402; Min Operating Temperature: -55°C; Max Operating Temperature: 125°C; Packaging: Cut Tape; Capacitance: 4.7pF; Voltage Rating: 16V; Length: 0.039inch; Width: 0.02inch; Thickness: 0.022inch; ComponentLink1URL: https://katalog.we-online.de/pbs/datasheet/885012005023.pdf?src-supplier=Digi-Key; ComponentLink1Description: https://katalog.we-online.de/pbs/datasheet/885012005023.pdf?src-supplier=Digi-Key; ComponentLink2URL: http://www.farnell.com/datasheets/2546554.pdf?src-supplier=Farnell; ComponentLink2Description: http://www.farnell.com/datasheets/2546554.pdf?src-supplier=Farnell; ComponentLink3URL: http://www.farnell.com/datasheets/2546554.pdf?src-supplier=Newark; ComponentLink3Description: http://www.farnell.com/datasheets/2546554.pdf?src-supplier=Newark; ComponentLink4URL: http://www.farnell.com/datasheets/2546554.pdf?src-supplier=Element14; ComponentLink4Description: http://www.farnell.com/datasheets/2546554.pdf?src-supplier=Element14; Supplier Part Number 1: 732-7439-6-ND
C34 C35 = CL03A105MO3NRNH: as C19 on sheet Driver Section; Supplier 1: Digi-Key; Manufacturer Part Number: CL03A105MO3NRNH; RoHS: Yes; Category: Ceramic Capacitors; Stock 1: 66067; Pricing 1: 1=0.27000, 10=0.18500, 50=0.11080, 100=0.09360, 500=0.06406, 1000=0.05667, 2500=0.05421, 5000=0.04928 (USD); Mount: Surface Mount; Case/Package: 0201; Case Code (Metric): 0603; Case Code (Imperial): 0201; Min Operating Temperature: -55°C; Max Operating Temperature: 85°C; Packaging: Tape and Reel; Capacitance: 1uF; Voltage Rating: 16V; Length: 0.024inch; Width: 0.012inch; Thickness: 0.013inch; RoHS Compliant: Yes; ComponentLink1URL: http://www.samsungsem.com/kr/support/product-search/mlcc/CL03A105MO3NRNH.jsp?src-supplier=Digi-Key; ComponentLink1Description: http://www.samsungsem.com/kr/support/product-search/mlcc/CL03A105MO3NRNH.jsp?src-supplier=Digi-Key; Supplier Part Number 1: 1276-6798-1-ND
J5 = U.FL-R-SMT-1(80): CONN U.FL RCPT STR 50 OHM SMD; Manufacturer: Hirose; Supplier 1: Future Electronics; Manufacturer Part Number: U.FL-R-SMT-1(80); Stock 1: 1272; Pricing 1: 1=1.07, 500=0.785, 1500=0.74, 2500=0.72, 5000=0.695 (USD); Case/Package: SMD/SMT; Package Quantity: 10000; Packaging: Tape and Reel; Lead Free: Lead Free; ComponentLink1URL: https://www.hirose.com/product/en/download_file/key_name/U.FL-R-SMT-1%2880%29/category/Specification%20Sheet/doc_file_id/37638/?file_category_id=9&item_id=03310472280&is_series=&src-supplier=Digi-Key; ComponentLink1Description: https://www.hirose.com/product/en/download_file/key_name/U.FL-R-SMT-1%2880%29/category/Specification%20Sheet/doc_file_id/37638/?file_category_id=9&item_id=03310472280&is_series=&src-supplier=Digi-Key; ComponentLink2URL: http://www.mouser.com/ds/2/185/U.FL_catalog-939761.pdf?src-supplier=Mouser; ComponentLink2Description: http://www.mouser.com/ds/2/185/U.FL_catalog-939761.pdf?src-supplier=Mouser; Supplier Part Number 1: U.FL-R-SMT-1(80)-CUTT
L3 = HLC021R6BTTR: FIXED IND 1.6NH 660MA 150 MOHM; Manufacturer: Kyocera AVX; Core Material: Non-Magnetic; DC Resistance (DCR): 150mR; Shielding: Unshielded; Self Resonant Frequency: 18GHz; Test Frequency: 450MHz; Q Factor: 25; Supplier 1: Digi-Key; Manufacturer Part Number: HLC021R6BTTR; Stock 1: 5000; Pricing 1: 1=0.41, 10=0.36, 25=0.3152, 50=0.2704, 100=0.2478, 250=0.22524, 500=0.21174, 1000=0.16218, 2500=0.15317 (USD); Mount: Surface Mount; Case/Package: 0402; Case Code (Metric): 1005; Case Code (Imperial): 0402; Min Operating Temperature: -55°C; Max Operating Temperature: 125°C; Inductance: 1.6nH; Max DC Current: 660mA; Packaging: Tape and Reel; Package Quantity: 5000; Current Rating: 660mA; Termination: SMD/SMT; Length: 1mm; Height: 0.35mm; Depth: 0.66mm; Width: 0.023inch; Height - Seated (Max): 0.018inch; Radiation Hardening: No; REACH SVHC: No SVHC; Lead Free: Lead Free; ComponentLink1URL: https://media.digikey.com/pdf/Data%20Sheets/AVX%20PDFs/MLO%20High%20Current%20Inductors.pdf?src-supplier=Digi-Key; ComponentLink1Description: https://media.digikey.com/pdf/Data%20Sheets/AVX%20PDFs/MLO%20High%20Current%20Inductors.pdf?src-supplier=Digi-Key; ComponentLink2URL: http://www.avx.com/docs/catalogs/mlohighcurrentinductor.pdf?src-supplier=Future+Electronics; ComponentLink2Description: http://www.avx.com/docs/catalogs/mlohighcurrentinductor.pdf?src-supplier=Future+Electronics; Supplier Part Number 1: 478-HLC021R6BTCT-ND
LED2 = IN-S63AT5UW: Led White Clear 0603 SMD; Manufacturer: Inolux; Lens Style: Flat; Luminous Intensity: 900mcd; Forward Voltage: 3V; Test Current: 5mA; Viewing Angle: 120°; Lens Size: 0.8mm; Supplier 1: Digi-Key; Manufacturer Part Number: IN-S63AT5UW; RoHS: No; Category: LEDs; Stock 1: 275915; Pricing 1: 1=0.33000, 10=0.17700, 100=0.08210, 500=0.07576, 1000=0.05934, 2000=0.05808 (USD); Mount: Surface Mount; Case/Package: 0603; Color: White; Lens Color: Clear; Case Code (Imperial): 0603; Case Code (Metric): 1608; Packaging: Tape and Reel; Lens Transparency: Clear; Length: 1.6mm; Width: 0.8mm; Height: 0.4mm; ComponentLink1URL: http://www.inolux-corp.com/datasheet/SMDLED/Mono%20Color%20Top%20View/IN-S63AT%20Series_V1.1.pdf?src-supplier=Digi-Key; ComponentLink1Description: http://www.inolux-corp.com/datasheet/SMDLED/Mono%20Color%20Top%20View/IN-S63AT%20Series_V1.1.pdf?src-supplier=Digi-Key; Supplier Part Number 1: 1830-1063-1-ND
Q1 = UMH3NTN: TRANS 2NPN PREBIAS 0.15W UMT6; Manufacturer: Rohm; Collector Emitter Voltage (VCEO): 50V; Emitter Base Voltage (VEBO): 5V; Max Collector Current: 100mA; Element Configuration: Dual; hFE Min: 100; Polarity: NPN; Power Dissipation: 150mW; Transition Frequency: 250MHz; Supplier 1: Digi-Key; Manufacturer Part Number: UMH3NTN; Stock 1: 12797; Pricing 1: 1=0.39, 10=0.293, 25=0.264, 100=0.1392, 500=0.12336, 1000=0.096 (USD); Mount: Surface Mount; Case/Package: SOT-363; Number of Pins: 6; Min Operating Temperature: -55°C; Max Operating Temperature: 150°C; Max Output Current: 100mA; Operating Supply Voltage: 50V; Packaging: Tape and Reel; Package Quantity: 1; Continuous Collector Current: 100mA; Collector Emitter Breakdown Voltage: 50V; Max Power Dissipation: 150mW; Max Breakdown Voltage: 50V; Voltage Rating (DC): 50V; Current Rating: 100mA; Collector Base Voltage (VCBO): 50V; Radiation Hardening: No; REACH SVHC: No SVHC; Lead Free: Lead Free; ComponentLink1URL: http://www.farnell.com/datasheets/1645293.pdf?src-supplier=Element14; ComponentLink1Description: http://www.farnell.com/datasheets/1645293.pdf?src-supplier=Element14; ComponentLink2URL: http://rohmfs.rohm.com/en/products/databook/datasheet/discrete/transistor/digital/emh3t2r-e.pdf?src-supplier=Digi-Key; ComponentLink2Description: http://rohmfs.rohm.com/en/products/databook/datasheet/discrete/transistor/digital/emh3t2r-e.pdf?src-supplier=Digi-Key; ComponentLink3URL: http://rohmfs.rohm.com/en/techdata_basic/transistor/taping/UMT6_TN_taping.pdf?src-supplier=Digi-Key; ComponentLink3Description: http://rohmfs.rohm.com/en/techdata_basic/transistor/taping/UMT6_TN_taping.pdf?src-supplier=Digi-Key; ComponentLink4URL: http://www.produktinfo.conrad.com/datenblaetter/125000-149999/140593-da-01-en-TRANSISTOR_UMH3_NTN_SOT_363.pdf?src-supplier=Conrad; ComponentLink4Description: http://www.produktinfo.conrad.com/datenblaetter/125000-149999/140593-da-01-en-TRANSISTOR_UMH3_NTN_SOT_363.pdf?src-supplier=Conrad; Supplier Part Number 1: UMH3NTNCT-ND
R16 = RC0201JR-0710KL: as RF3 on sheet Driver Section; Case Code (Imperial): 0201; Case Code (Metric): 0603; Case/Package: 0201; Category: Chip SMD Resistors; Contact Plating: Tin,Matte; Depth: 0.3mm; Lead Free: Lead Free; Length: 0.6mm; Manufacturer Part Number: RC0201JR-0710KL; Max Operating Temperature: 125°C; Military Standard: Not; Min Operating Temperature: -55°C; Packaging: Tape and Reel; Radiation Hardening: No; REACH SVHC: Unknown; Resistor Type: Thick Film; Termination: SMD/SMT; Tolerance: 5%; Voltage Rating: 25V; ComponentLink1Description: New link; ComponentLink1URL: *; Supplier 1: Digi-Key; RoHS: Yes; Stock 1: 1488597; Pricing 1: 1=0.10000, 10=0.02600, 100=0.01050, 1000=0.00472, 2500=0.00410, 5000=0.00338 (USD); ComponentLink2URL: https://datasheet.ciiva.com/8891/pyu-rc0201-51-rohs-l-8-8891388.pdf?src-supplier=Avnet; ComponentLink2Description: https://datasheet.ciiva.com/8891/pyu-rc0201-51-rohs-l-8-8891388.pdf?src-supplier=Avnet; ComponentLink3URL: https://datasheet.ciiva.com/7672/1563626-7672253.pdf?src-supplier=Element14; ComponentLink3Description: https://datasheet.ciiva.com/7672/1563626-7672253.pdf?src-supplier=Element14; ComponentLink4URL: https://datasheet.ciiva.com/28405/pyu-rc0201-51-rohs-l-8-28405613.pdf?src-supplier=Avnet+Europe; ComponentLink4Description: https://datasheet.ciiva.com/28405/pyu-rc0201-51-rohs-l-8-28405613.pdf?src-supplier=Avnet+Europe; ComponentLink5URL: https://datasheet.ciiva.com/7672/1563626-7672254.pdf?src-supplier=Element14; ComponentLink5Description: https://datasheet.ciiva.com/7672/1563626-7672254.pdf?src-supplier=Element14; ComponentLink6URL: https://datasheet.ciiva.com/7660/1421516-7660810.pdf?src-supplier=Element14; ComponentLink6Description: https://datasheet.ciiva.com/7660/1421516-7660810.pdf?src-supplier=Element14; ComponentLink7URL: https://datasheet.ciiva.com/16856/pyu-rc0201-51-rohs-l-8-16856011.pdf?src-supplier=Avnet+Europe; ComponentLink7Description: https://datasheet.ciiva.com/16856/pyu-rc0201-51-rohs-l-8-16856011.pdf?src-supplier=Avnet+Europe; ComponentLink8URL: https://datasheet.ciiva.com/46391/1421516-46391291.pdf?src-supplier=Element14; ComponentLink8Description: https://datasheet.ciiva.com/46391/1421516-46391291.pdf?src-supplier=Element14; Supplier Part Number 1: 311-10KNCT-ND
R17 = RC0201JR-071K2L: RES SMD 1.2K OHM 5% 1/20W 0201; Manufacturer: Yageo; Temperature Coefficient: 200ppm/°C; Resistance: 1.2kR; Max Power Dissipation: 50mW; Supplier 1: Digi-Key; Manufacturer Part Number: RC0201JR-071K2L; RoHS: Yes; Category: Chip SMD Resistors; Stock 1: 285; Pricing 1: 1=0.10000, 10=0.02600, 100=0.01040, 1000=0.00466, 2500=0.00405, 5000=0.00334 (USD); Case/Package: 0201; Contact Plating: Tin,Matte; Case Code (Imperial): 0201; Case Code (Metric): 0603; Min Operating Temperature: -55°C; Max Operating Temperature: 125°C; Resistor Type: Thick Film; Tolerance: 5%; Number of Terminations: 2; Package Quantity: 1; Packaging: Tape and Reel; Features: Moisture Resistant; Length: 0.024inch; Width: 0.012inch; Height: 0.01inch; Radiation Hardening: No; ComponentLink1URL: https://datasheet.ciiva.com/8895/pyu-rc0201-51-rohs-l-8-8895816.pdf?src-supplier=Avnet; ComponentLink1Description: https://datasheet.ciiva.com/8895/pyu-rc0201-51-rohs-l-8-8895816.pdf?src-supplier=Avnet; ComponentLink2URL: https://datasheet.ciiva.com/16855/pyu-rc0201-51-rohs-l-8-16855241.pdf?src-supplier=Avnet+Europe; ComponentLink2Description: https://datasheet.ciiva.com/16855/pyu-rc0201-51-rohs-l-8-16855241.pdf?src-supplier=Avnet+Europe; ComponentLink3URL: https://datasheet.ciiva.com/2462/pyu-r-int-thick-7-2462826.pdf?src-supplier=Digi-Key; ComponentLink3Description: https://datasheet.ciiva.com/2462/pyu-r-int-thick-7-2462826.pdf?src-supplier=Digi-Key; ComponentLink4URL: https://datasheet.ciiva.com/2462/pyu-r-int-thick-7-2462827.pdf?src-supplier=Digi-Key; ComponentLink4Description: https://datasheet.ciiva.com/2462/pyu-r-int-thick-7-2462827.pdf?src-supplier=Digi-Key; ComponentLink5URL: https://datasheet.ciiva.com/28418/pyu-rc0201-51-rohs-l-8-28418507.pdf?src-supplier=Avnet+Europe; ComponentLink5Description: https://datasheet.ciiva.com/28418/pyu-rc0201-51-rohs-l-8-28418507.pdf?src-supplier=Avnet+Europe; ComponentLink6URL: https://datasheet.ciiva.com/2462/pyu-r-int-thick-7-2462828.pdf?src-supplier=Digi-Key; ComponentLink6Description: https://datasheet.ciiva.com/2462/pyu-r-int-thick-7-2462828.pdf?src-supplier=Digi-Key; Supplier Part Number 1: 311-1.2KNCT-ND
RF5 = RC0201FR-071KP: as R11 on sheet Connector Section; Supplier 1: Digi-Key; Manufacturer Part Number: RC0201FR-071KP; RoHS: Yes; Stock 1: 4800; Pricing 1: 1=0.11000, 10=0.10200, 100=0.03940, 1000=0.01734, 2500=0.01497, 5000=0.01340 (USD); RoHS Compliant: Yes; Supplier Part Number 1: 13-RC0201FR-071KPCT-ND
SB1 SB2 = Solder Bridge: Solder Bridge ON
SW2 = 434121025816: SWITCH TACTILE SPST-NO 0.05A 12V; Manufacturer: Wurth Electronics; Mechanical Life: 50000Cycles; Actuator Material: Polymer,Liquid Crystal Polymer; Contact Current Rating: 50mA; Operating Force: 160gf; Illumination Type: Non-Illuminated,Illuminated; Throw Configuration: SPST; Insulation Resistance: 100MR; Switch Travel: 0.25mm; Switch Function: Off-Mom; Actuator Type: Standard; Actuator Length: 0.8mm; Supplier 1: Digi-Key; Manufacturer Part Number: 434121025816; RoHS: Yes; Category: Tactile Switches; Stock 1: 2355; Pricing 1: 1=0.55000, 50=0.50700, 100=0.46100, 500=0.41900, 1000=0.36400 (USD); Mount: Surface Mount; Contact Material: Stainless Steel,Steel; Min Operating Temperature: -40°C; Max Operating Temperature: 85°C; Current Rating: 50mA; Packaging: Tape and Reel; Termination: SMD/SMT; Length: 7.3mm; Width: 3.9mm; Height: 2.5mm; REACH SVHC: No SVHC; Lead Free: Lead Free; ComponentLink1URL: https://datasheet.ciiva.com/30466/0900766b8126b630-30466740.pdf?src-supplier=RSComponents; ComponentLink1Description: https://datasheet.ciiva.com/30466/0900766b8126b630-30466740.pdf?src-supplier=RSComponents; ComponentLink2URL: https://datasheet.ciiva.com/29123/711753-da-01-en-taster-434121025816-29123820.pdf?src-supplier=Conrad; ComponentLink2Description: https://datasheet.ciiva.com/29123/711753-da-01-en-taster-434121025816-29123820.pdf?src-supplier=Conrad; ComponentLink3URL: https://datasheet.ciiva.com/1532/434121025816-1532523.pdf?src-supplier=Element14; ComponentLink3Description: https://datasheet.ciiva.com/1532/434121025816-1532523.pdf?src-supplier=Element14; ComponentLink4URL: https://datasheet.ciiva.com/1633/434121025816-1633932.pdf?src-supplier=Farnell; ComponentLink4Description: https://datasheet.ciiva.com/1633/434121025816-1633932.pdf?src-supplier=Farnell; Supplier Part Number 1: 732-7045-1-ND
U4 = ESP32-PICO-D4: RX TXRX MOD WIFI SURFACE MOUNT; Manufacturer: Espressif Systems; Frequency: 2.5GHz; Interface: I2C,SPI,GPIO,PWM,SDIO,UART; Data Rate: 150Mbps; Sensitivity: -98.4dBm; Memory Size: 4MB; Supplier 1: Digi-Key; Manufacturer Part Number: ESP32-PICO-D4; Stock 1: 5967; Pricing 1: 1=4.5 (USD); Mount: Surface Mount; Case/Package: SMD/SMT; Min Operating Temperature: -40°C; Max Operating Temperature: 85°C; ComponentLink1URL: https://www.espressif.com/sites/default/files/documentation/esp32-pico-d4_datasheet_en.pdf?src-supplier=Digi-Key; ComponentLink1Description: https://www.espressif.com/sites/default/files/documentation/esp32-pico-d4_datasheet_en.pdf?src-supplier=Digi-Key; Supplier Part Number 1: 1904-1029-1-ND
U8 = PRO-OB-440: RF ANT 2.4GHZ STAMPED MET SLD; Manufacturer: Proant; Number of Bands: 1; Return Loss: -10dB; Supplier 1: Digi-Key; Manufacturer Part Number: PRO-OB-440; Stock 1: 23502; Pricing 1: 1=0.74, 10=0.647, 25=0.608, 100=0.4964, 250=0.46104, 500=0.39238 (USD); Mount: Surface Mount; Packaging: Cut Tape; Termination: Solder; ComponentLink1URL: https://media.digikey.com/pdf/Data%20Sheets/Proant%20PDF's/PRO-OB-440_Dwg.PDF?src-supplier=Digi-Key; ComponentLink1Description: https://media.digikey.com/pdf/Data%20Sheets/Proant%20PDF's/PRO-OB-440_Dwg.PDF?src-supplier=Digi-Key; ComponentLink2URL: http://www.proant.se/files/user/Application%20note%20-%20OnBoard%20SMD%20GNSS%20rev%202.0.pdf?src-supplier=Digi-Key; ComponentLink2Description: http://www.proant.se/files/user/Application%20note%20-%20OnBoard%20SMD%20GNSS%20rev%202.0.pdf?src-supplier=Digi-Key; ComponentLink3URL: http://www.proant.se/files/user/Documents/Datasheet%20-%20OnBoard%20SMD%202400%20MHz%20rev%203.pdf?src-supplier=Digi-Key; ComponentLink3Description: http://www.proant.se/files/user/Documents/Datasheet%20-%20OnBoard%20SMD%202400%20MHz%20rev%203.pdf?src-supplier=Digi-Key; Supplier Part Number 1: 1532-1001-6-ND
U9 = LY68L6400SLIT: Volatile 64Mb (8M x 8) SPI/ QPI 2.7V ~ 3.6V SOP-8_150mil RAM RoHS; Manufacturer: Lyontek Inc.; Value: Custom; Manufacturer Part No: LY68L6400SLIT; Package: SOP-8

## Nets that join several sheets
3V3: Power Section (7 pins), Connector Section (J3.1 R18.1), Driver Section (C23.2 U5.15), Control_Sheet (16 pins)
8V: Power Section (C4.2 C5.2 R2.1 U1.6), Driver Section (6 pins)
BAT: Power Section (11 pins), Connector Section (J1.1 R10.2)
GND: Power Section (21 pins), Wireless Charging Section (6 pins), Connector Section (7 pins), Driver Section (14 pins), Control_Sheet (21 pins)
V_CHG: Power Section (C6.2 U2.1), Wireless Charging Section (C31.2 L2.1 R27.2)
~{DRI}~{VE_EN}_: Driver Section (RF3.2 U5.2), Control_Sheet (U4.22)
ADC_BAT: Connector Section (R10.1 R13.2), Control_Sheet (U4.17)
CHG_: Power Section (RF1.2 U2.8), Control_Sheet (U4.21)
DIR_: Driver Section (U5.19), Control_Sheet (U4.25)
DTR: Connector Section (J3.5), Control_Sheet (Q1.2 Q1.4)
OA1#: Connector Section (J4.1), Driver Section (U5.24)
OA2#: Connector Section (J4.2), Driver Section (U5.21)
OB1#: Connector Section (J4.3), Driver Section (U5.26)
OB2#: Connector Section (J4.4), Driver Section (U5.1)
PWR_EN: Power Section (RF2.2 U1.7), Control_Sheet (U4.15)
RTS: Connector Section (J3.4), Control_Sheet (Q1.1 Q1.5)
RXD: Connector Section (J3.3), Control_Sheet (U4.40)
STDBY: Driver Section (U5.20), Control_Sheet (U4.24)
STEP_: Driver Section (U5.16), Control_Sheet (U4.27)
TEMP_A: Connector Section (R8.2 R11.2), Control_Sheet (U4.34)
TEMP_B: Connector Section (R12.2 R14.2), Control_Sheet (U4.13)
TS_: Power Section (U2.9), Connector Section (J1.2)
TXD: Connector Section (J3.2), Control_Sheet (U4.41)
UART_IO_: Driver Section (U5.14), Control_Sheet (RF5.2 U4.38)
W_Pad1: Wireless Charging Section (C29.1 D2.1), Connector Section (J2.1)